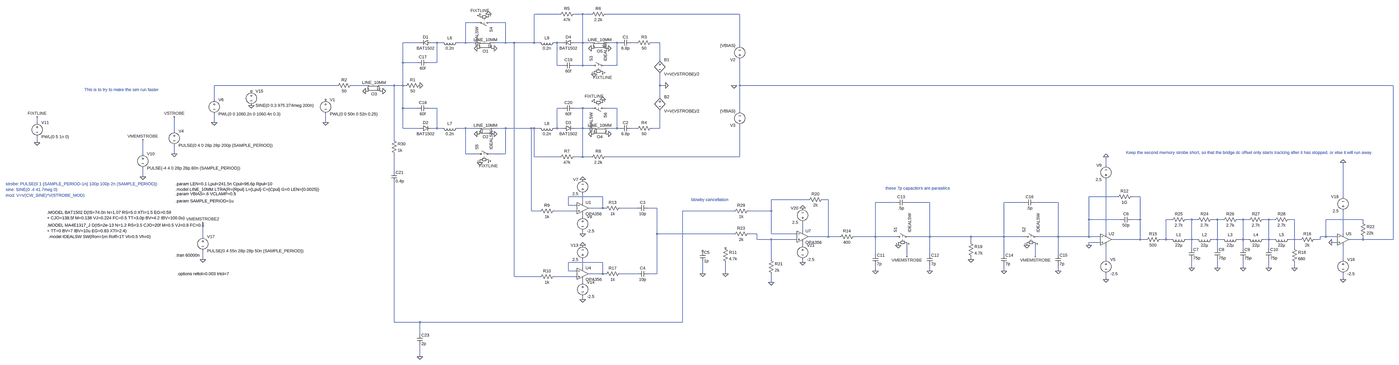
[diagram p0: schematic Draft17.asc, whole sheet]
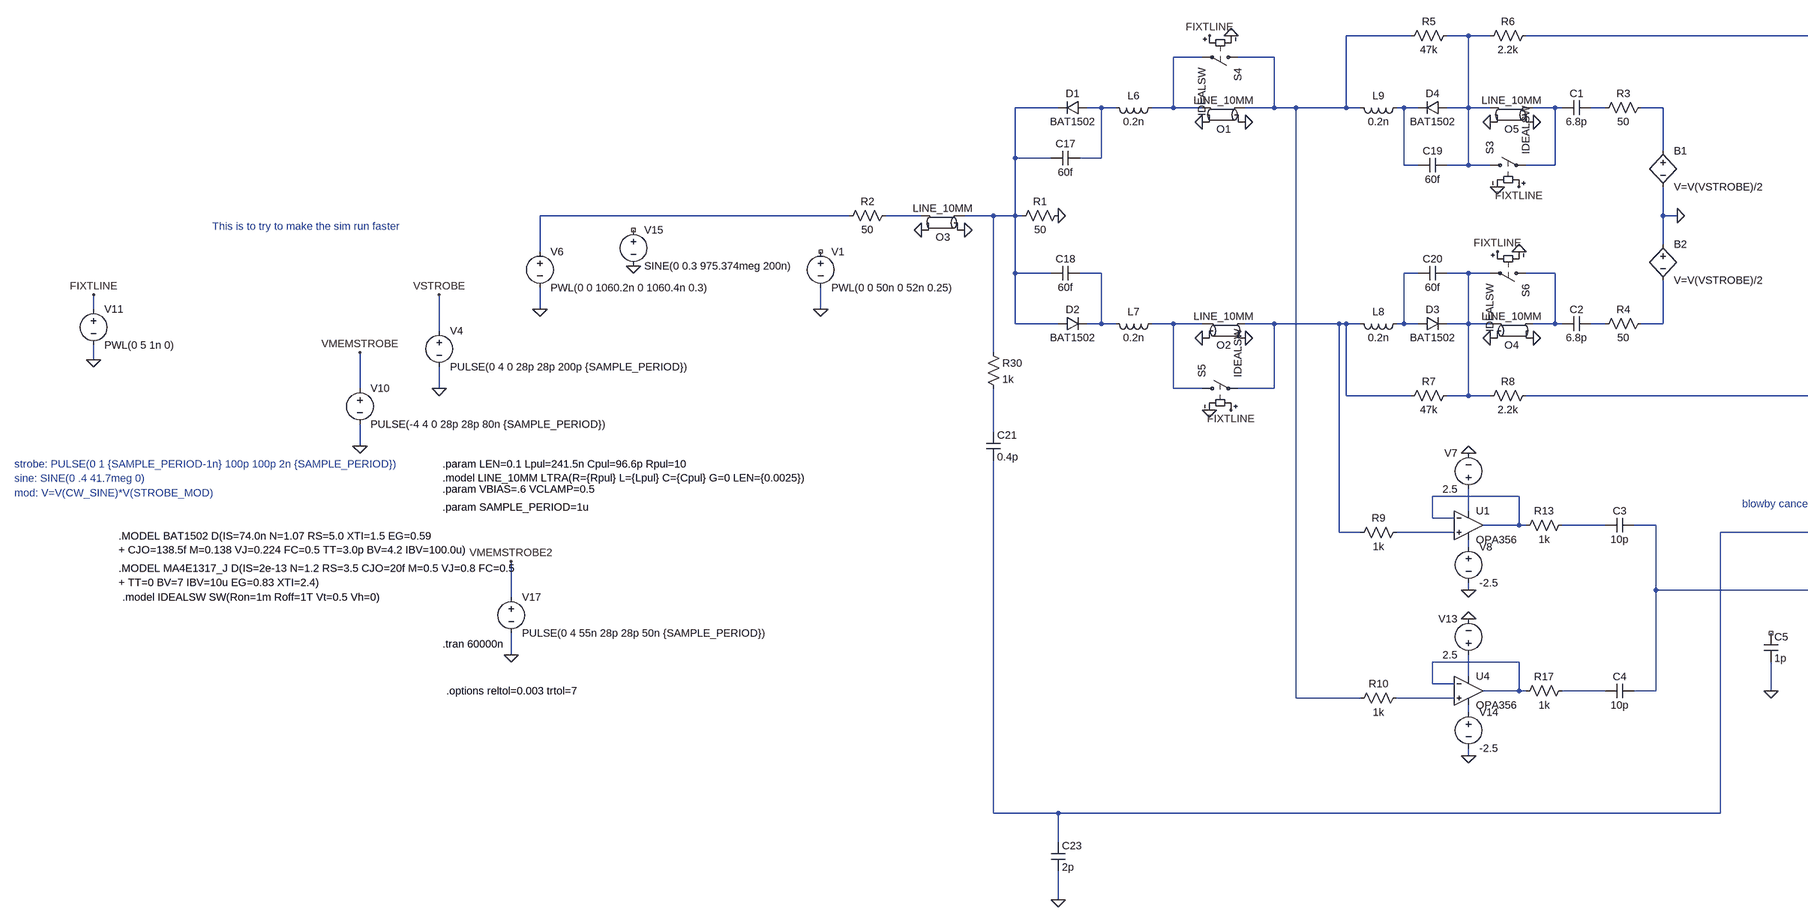
[diagram p1: schematic Draft17.asc, part, row 1 of 1, column 1 of 2]
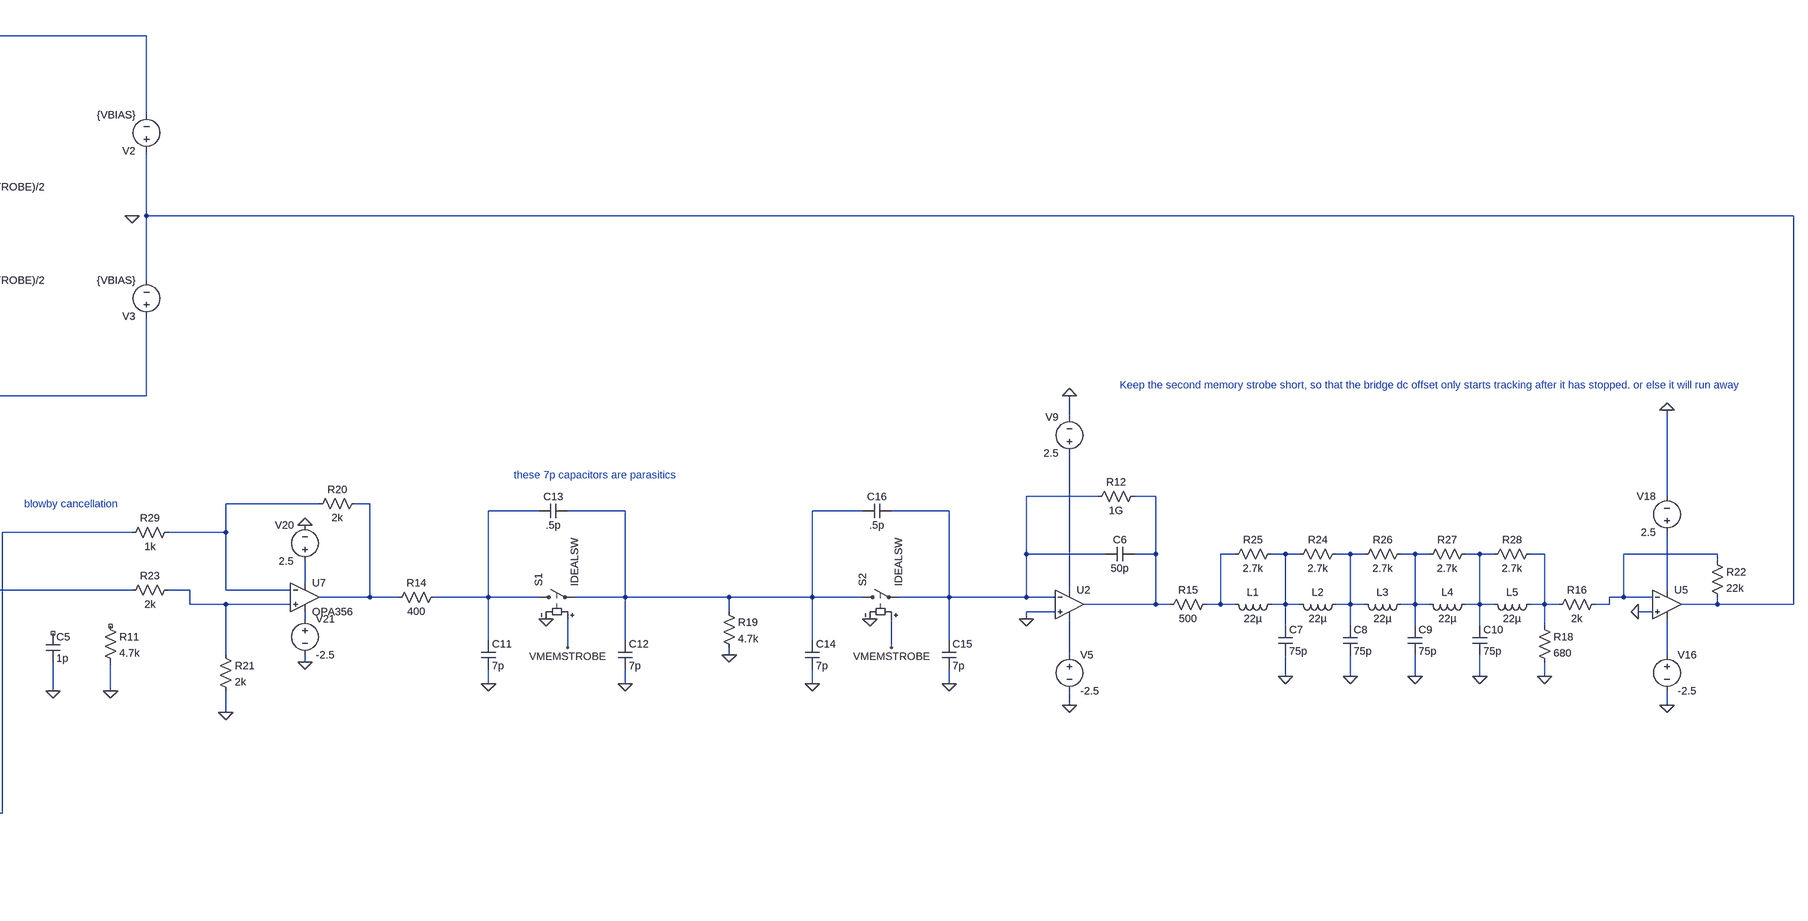
[diagram p2: schematic Draft17.asc, part, row 1 of 1, column 2 of 2]
Draft17.asc, the LTspice schematic file:
Version 4.1
SHEET 1 6916 1460
WIRE 1440 -656 1296 -656
WIRE 1568 -656 1520 -656
WIRE 1616 -656 1568 -656
WIRE 2448 -656 1696 -656
WIRE 976 -608 912 -608
WIRE 1136 -608 1056 -608
WIRE 656 -496 560 -496
WIRE 752 -496 720 -496
WIRE 784 -496 752 -496
WIRE 912 -496 912 -608
WIRE 912 -496 864 -496
WIRE 976 -496 912 -496
WIRE 1136 -496 1136 -608
WIRE 1136 -496 1072 -496
WIRE 1184 -496 1136 -496
WIRE 1296 -496 1296 -656
WIRE 1296 -496 1184 -496
WIRE 1328 -496 1296 -496
WIRE 1424 -496 1408 -496
WIRE 1456 -496 1424 -496
WIRE 1568 -496 1568 -656
WIRE 1568 -496 1520 -496
WIRE 1616 -496 1568 -496
WIRE 1760 -496 1712 -496
WIRE 1776 -496 1760 -496
WIRE 1872 -496 1840 -496
WIRE 2000 -496 1952 -496
WIRE 2448 -480 2448 -656
WIRE 2000 -400 2000 -496
WIRE 560 -384 560 -496
WIRE 640 -384 560 -384
WIRE 752 -384 752 -496
WIRE 752 -384 704 -384
WIRE 1424 -368 1424 -496
WIRE 1456 -368 1424 -368
WIRE 1568 -368 1568 -496
WIRE 1568 -368 1520 -368
WIRE 1616 -368 1568 -368
WIRE 1760 -368 1760 -496
WIRE 1760 -368 1696 -368
WIRE 192 -256 -496 -256
WIRE 352 -256 272 -256
WIRE 512 -256 448 -256
WIRE 560 -256 560 -384
WIRE 560 -256 512 -256
WIRE 576 -256 560 -256
WIRE 2000 -256 2000 -320
WIRE 2032 -256 2000 -256
WIRE 2448 -256 2448 -400
WIRE 6912 -256 2448 -256
WIRE 2000 -192 2000 -256
WIRE -496 -176 -496 -256
WIRE 560 -128 560 -256
WIRE 640 -128 560 -128
WIRE 752 -128 704 -128
WIRE 1456 -128 1424 -128
WIRE 1568 -128 1520 -128
WIRE 1616 -128 1568 -128
WIRE 1760 -128 1696 -128
WIRE 2448 -112 2448 -256
WIRE -1488 -48 -1488 -80
WIRE -496 -48 -496 -96
WIRE 128 -48 128 -96
WIRE 560 -16 560 -128
WIRE 656 -16 560 -16
WIRE 752 -16 752 -128
WIRE 752 -16 720 -16
WIRE 784 -16 752 -16
WIRE 912 -16 864 -16
WIRE 976 -16 912 -16
WIRE 1136 -16 1072 -16
WIRE 1280 -16 1136 -16
WIRE 1296 -16 1280 -16
WIRE 1328 -16 1296 -16
WIRE 1424 -16 1424 -128
WIRE 1424 -16 1408 -16
WIRE 1456 -16 1424 -16
WIRE 1568 -16 1568 -128
WIRE 1568 -16 1520 -16
WIRE 1616 -16 1568 -16
WIRE 1760 -16 1760 -128
WIRE 1760 -16 1712 -16
WIRE 1776 -16 1760 -16
WIRE 1872 -16 1840 -16
WIRE 2000 -16 2000 -112
WIRE 2000 -16 1952 -16
WIRE -720 0 -720 -80
WIRE 512 48 512 -256
WIRE -1488 64 -1488 32
WIRE -896 128 -896 48
WIRE -720 128 -720 80
WIRE 912 128 912 -16
WIRE 976 128 912 128
WIRE 1136 128 1136 -16
WIRE 1136 128 1056 128
WIRE 1296 144 1296 -16
WIRE 1440 144 1296 144
WIRE 1568 144 1568 -16
WIRE 1568 144 1520 144
WIRE 1616 144 1568 144
WIRE 2448 144 2448 -32
WIRE 2448 144 1696 144
WIRE 4976 192 4976 144
WIRE 512 224 512 128
WIRE -896 256 -896 208
WIRE 1680 368 1488 368
WIRE 5040 368 4880 368
WIRE 5168 368 5120 368
WIRE 6304 368 6304 176
WIRE 2832 384 2624 384
WIRE 2944 384 2912 384
WIRE 1568 400 1568 352
WIRE 3360 400 3248 400
WIRE 3552 400 3424 400
WIRE 4368 400 4256 400
WIRE 4560 400 4432 400
WIRE 1488 416 1488 368
WIRE 1536 416 1488 416
WIRE 1680 432 1680 368
WIRE 1680 432 1600 432
WIRE 1696 432 1680 432
WIRE 1872 432 1776 432
WIRE 1984 432 1936 432
WIRE 1280 448 1280 -16
WIRE 1328 448 1280 448
WIRE 1536 448 1408 448
WIRE 2416 448 2128 448
WIRE 2624 448 2624 384
WIRE 2624 448 2496 448
WIRE 1568 480 1568 464
WIRE 4880 496 4880 368
WIRE 5056 496 4880 496
WIRE 5168 496 5168 368
WIRE 5168 496 5120 496
WIRE 5344 496 5312 496
WIRE 5456 496 5424 496
WIRE 5488 496 5456 496
WIRE 5600 496 5568 496
WIRE 5632 496 5600 496
WIRE 5744 496 5712 496
WIRE 5776 496 5744 496
WIRE 5888 496 5856 496
WIRE 5920 496 5888 496
WIRE 6032 496 6000 496
WIRE 6416 496 6208 496
WIRE 6416 512 6416 496
WIRE 2800 560 2800 512
WIRE 1568 576 1568 560
WIRE 1984 576 1984 432
WIRE 2416 576 1984 576
WIRE 2544 576 2496 576
WIRE 2624 576 2624 448
WIRE 2768 576 2624 576
WIRE 4976 576 4976 272
WIRE 6304 576 6304 448
WIRE -560 592 -560 512
WIRE 2944 592 2944 384
WIRE 2944 592 2832 592
WIRE 3008 592 2944 592
WIRE 3248 592 3248 400
WIRE 3248 592 3088 592
WIRE 3360 592 3248 592
WIRE 3552 592 3552 400
WIRE 3552 592 3440 592
WIRE 3888 592 3552 592
WIRE 4256 592 4256 400
WIRE 4256 592 3888 592
WIRE 4368 592 4256 592
WIRE 4560 592 4560 400
WIRE 4560 592 4448 592
WIRE 4880 592 4880 496
WIRE 4880 592 4560 592
WIRE 4944 592 4880 592
WIRE 6208 592 6208 496
WIRE 6208 592 6176 592
WIRE 6272 592 6208 592
WIRE 2544 608 2544 576
WIRE 2624 608 2544 608
WIRE 2768 608 2624 608
WIRE 5168 608 5168 496
WIRE 5168 608 5008 608
WIRE 5200 608 5168 608
WIRE 5312 608 5312 496
WIRE 5312 608 5280 608
WIRE 5344 608 5312 608
WIRE 5456 608 5456 496
WIRE 5456 608 5424 608
WIRE 5488 608 5456 608
WIRE 5600 608 5600 496
WIRE 5600 608 5568 608
WIRE 5632 608 5600 608
WIRE 5744 608 5744 496
WIRE 5744 608 5712 608
WIRE 5776 608 5744 608
WIRE 5888 608 5888 496
WIRE 5888 608 5856 608
WIRE 5920 608 5888 608
WIRE 6032 608 6032 496
WIRE 6032 608 6000 608
WIRE 6064 608 6032 608
WIRE 6176 608 6176 592
WIRE 6176 608 6144 608
WIRE 6416 608 6416 592
WIRE 6416 608 6336 608
WIRE 6912 608 6912 -256
WIRE 6912 608 6416 608
WIRE 3888 624 3888 592
WIRE 4944 624 4880 624
WIRE 6272 624 6240 624
WIRE 2800 640 2800 624
WIRE 4880 640 4880 624
WIRE 5456 656 5456 608
WIRE 5600 656 5600 608
WIRE 5744 656 5744 608
WIRE 5888 656 5888 608
WIRE 6032 656 6032 608
WIRE 3248 688 3248 592
WIRE 3552 688 3552 592
WIRE 4256 688 4256 592
WIRE 4560 688 4560 592
WIRE 3424 704 3424 640
WIRE 4432 704 4432 640
WIRE -560 720 -560 672
WIRE 2624 720 2624 608
WIRE 3888 720 3888 704
WIRE 4976 720 4976 640
WIRE 6304 720 6304 640
WIRE 1680 736 1488 736
WIRE 2800 736 2800 720
WIRE 1568 768 1568 720
WIRE 5456 768 5456 720
WIRE 5600 768 5600 720
WIRE 5744 768 5744 720
WIRE 5888 768 5888 720
WIRE 6032 768 6032 736
WIRE 1488 784 1488 736
WIRE 1536 784 1488 784
WIRE 3248 784 3248 752
WIRE 3552 784 3552 752
WIRE 4256 784 4256 752
WIRE 4560 784 4560 752
WIRE 1680 800 1680 736
WIRE 1680 800 1600 800
WIRE 1696 800 1680 800
WIRE 1872 800 1776 800
WIRE 1984 800 1984 576
WIRE 1984 800 1936 800
WIRE 2240 800 2240 736
WIRE 2368 800 2368 736
WIRE 1184 816 1184 -496
WIRE 1328 816 1184 816
WIRE 1536 816 1408 816
WIRE 4976 832 4976 800
WIRE 6304 832 6304 800
WIRE 1568 848 1568 832
WIRE 2624 848 2624 800
WIRE 1568 944 1568 928
WIRE 512 1232 512 288
WIRE 656 1232 512 1232
WIRE 2128 1232 2128 448
WIRE 2128 1232 656 1232
WIRE 656 1296 656 1232
WIRE 656 1424 656 1360
FLAG 128 -48 0
FLAG 1072 16 0
FLAG 976 16 0
FLAG 976 -464 0
FLAG 1072 -464 0
FLAG 448 -224 0
FLAG 352 -224 0
FLAG 656 -256 0
FLAG 1712 16 0
FLAG 1616 16 0
FLAG 1616 -464 0
FLAG 1712 -464 0
FLAG 2032 -256 0
FLAG -720 128 0
FLAG -720 -80 VSTROBE
FLAG 2416 -256 0
FLAG -496 -48 0
FLAG 2368 800 0
FLAG 2240 800 0
FLAG 4880 640 0
FLAG 4976 144 0
FLAG 4976 832 0
FLAG -896 256 0
FLAG -896 48 VMEMSTROBE
FLAG 3424 704 VMEMSTROBE
FLAG 3376 640 0
FLAG -560 720 0
FLAG -560 512 VMEMSTROBE2
FLAG 2800 736 0
FLAG 2800 432 0
FLAG 1568 576 0
FLAG 1568 272 0
FLAG 1568 944 0
FLAG 1568 640 0
FLAG -288 -144 0
FLAG 6304 176 0
FLAG 6304 832 0
FLAG 5456 768 0
FLAG 5600 768 0
FLAG 5744 768 0
FLAG 5888 768 0
FLAG 3552 784 0
FLAG 3248 784 0
FLAG 6240 624 0
FLAG 6032 768 0
FLAG 4432 704 VMEMSTROBE
FLAG 4384 640 0
FLAG 4560 784 0
FLAG 4256 784 0
FLAG 3888 720 0
FLAG 1632 -320 0
FLAG 1680 -320 FIXTLINE
FLAG 1040 -656 0
FLAG 992 -656 FIXTLINE
FLAG 992 176 0
FLAG 1040 176 FIXTLINE
FLAG 1680 -176 0
FLAG 1632 -176 FIXTLINE
FLAG -1488 -80 FIXTLINE
FLAG -1488 64 0
FLAG 2624 848 0
FLAG 656 1424 0
SYMBOL voltage 128 -192 R0
WINDOW 123 0 0 Left 0
WINDOW 39 0 0 Left 0
SYMATTR InstName V1
SYMATTR Value PWL(0 0 50n 0 52n 0.25)
SYMBOL diode 720 -512 R90
WINDOW 0 0 32 VBottom 2
WINDOW 3 32 32 VTop 2
SYMATTR InstName D1
SYMATTR Value BAT1502
SYMBOL ltline 1024 -480 R180
SYMATTR InstName O1
SYMATTR Value LINE_10MM
SYMBOL ltline 1024 0 M180
SYMATTR InstName O2
SYMATTR Value LINE_10MM
SYMBOL diode 656 -32 M90
WINDOW 0 0 32 VBottom 2
WINDOW 3 32 32 VTop 2
SYMATTR InstName D2
SYMATTR Value BAT1502
SYMBOL diode 1456 -32 M90
WINDOW 0 0 32 VBottom 2
WINDOW 3 32 32 VTop 2
SYMATTR InstName D3
SYMATTR Value BAT1502
SYMBOL diode 1520 -512 R90
WINDOW 0 0 32 VBottom 2
WINDOW 3 32 32 VTop 2
SYMATTR InstName D4
SYMATTR Value BAT1502
SYMBOL res 672 -272 R90
WINDOW 0 0 56 VBottom 2
WINDOW 3 32 56 VTop 2
SYMATTR InstName R1
SYMATTR Value 50
SYMBOL ltline 400 -240 R180
SYMATTR InstName O3
SYMATTR Value LINE_10MM
SYMBOL res 288 -272 R90
WINDOW 0 0 56 VBottom 2
WINDOW 3 32 56 VTop 2
SYMATTR InstName R2
SYMATTR Value 50
SYMBOL ltline 1664 0 M180
SYMATTR InstName O4
SYMATTR Value LINE_10MM
SYMBOL ltline 1664 -480 R180
SYMATTR InstName O5
SYMATTR Value LINE_10MM
SYMBOL cap 1840 -512 R90
WINDOW 0 0 32 VBottom 2
WINDOW 3 32 32 VTop 2
SYMATTR InstName C1
SYMATTR Value 6.8p
SYMBOL cap 1840 -32 R90
WINDOW 0 0 32 VBottom 2
WINDOW 3 32 32 VTop 2
SYMATTR InstName C2
SYMATTR Value 6.8p
SYMBOL res 1968 -512 R90
WINDOW 0 0 56 VBottom 2
WINDOW 3 32 56 VTop 2
SYMATTR InstName R3
SYMATTR Value 50
SYMBOL res 1968 -32 R90
WINDOW 0 0 56 VBottom 2
WINDOW 3 32 56 VTop 2
SYMATTR InstName R4
SYMATTR Value 50
SYMBOL voltage -720 -16 R0
WINDOW 123 0 0 Left 0
WINDOW 39 0 0 Left 0
SYMATTR InstName V4
SYMATTR Value PULSE(0 4 0 28p 28p 200p {SAMPLE_PERIOD})
SYMBOL bv 2000 -416 R0
SYMATTR InstName B1
SYMATTR Value V=V(VSTROBE)/2
SYMBOL bv 2000 -208 R0
SYMATTR InstName B2
SYMATTR Value V=V(VSTROBE)/2
SYMBOL res 1536 -672 R90
WINDOW 0 0 56 VBottom 2
WINDOW 3 32 56 VTop 2
SYMATTR InstName R5
SYMATTR Value 47k
SYMBOL res 1712 -672 R90
WINDOW 0 0 56 VBottom 2
WINDOW 3 32 56 VTop 2
SYMATTR InstName R6
SYMATTR Value 2.2k
SYMBOL res 1536 128 R90
WINDOW 0 0 56 VBottom 2
WINDOW 3 32 56 VTop 2
SYMATTR InstName R7
SYMATTR Value 47k
SYMBOL res 1712 128 R90
WINDOW 0 0 56 VBottom 2
WINDOW 3 32 56 VTop 2
SYMATTR InstName R8
SYMATTR Value 2.2k
SYMBOL voltage 2448 -384 R180
WINDOW 123 0 0 Left 0
WINDOW 39 0 0 Left 0
SYMATTR InstName V2
SYMATTR Value {VBIAS}
SYMBOL voltage 2448 -16 R180
WINDOW 123 0 0 Left 0
WINDOW 39 0 0 Left 0
SYMATTR InstName V3
SYMATTR Value {VBIAS}
SYMBOL res 1424 432 R90
WINDOW 0 0 56 VBottom 2
WINDOW 3 32 56 VTop 2
SYMATTR InstName R9
SYMATTR Value 1k
SYMBOL res 1424 800 R90
WINDOW 0 0 56 VBottom 2
WINDOW 3 32 56 VTop 2
SYMATTR InstName R10
SYMATTR Value 1k
SYMBOL cap 1936 416 R90
WINDOW 0 0 32 VBottom 2
WINDOW 3 32 32 VTop 2
SYMATTR InstName C3
SYMATTR Value 10p
SYMBOL cap 1936 784 R90
WINDOW 0 0 32 VBottom 2
WINDOW 3 32 32 VTop 2
SYMATTR InstName C4
SYMATTR Value 10p
SYMBOL voltage -496 -192 R0
WINDOW 123 0 0 Left 0
WINDOW 39 0 0 Left 0
SYMATTR InstName V6
SYMATTR Value PWL(0 0 1060.2n 0 1060.4n 0.3)
SYMBOL cap 2224 672 R0
SYMATTR InstName C5
SYMATTR Value 1p
SYMBOL res 3104 576 R90
WINDOW 0 0 56 VBottom 2
WINDOW 3 32 56 VTop 2
SYMATTR InstName R14
SYMATTR Value 400
SYMBOL sw 3344 592 R270
SYMATTR InstName S1
SYMATTR Value IDEALSW
SYMBOL OpAmps\\UniversalOpamp2 4976 608 R0
SYMATTR InstName U2
SYMATTR Value2 Avol=1Meg GBW=100Meg Slew=100Meg
SYMBOL cap 5120 480 R90
WINDOW 0 0 32 VBottom 2
WINDOW 3 32 32 VTop 2
SYMATTR InstName C6
SYMATTR Value 50p
SYMBOL voltage 4976 704 R0
WINDOW 123 0 0 Left 0
WINDOW 39 0 0 Left 0
SYMATTR InstName V5
SYMATTR Value -2.5
SYMBOL voltage 4976 288 R180
WINDOW 0 24 96 Left 2
WINDOW 3 24 16 Left 2
WINDOW 123 0 0 Left 0
WINDOW 39 0 0 Left 0
SYMATTR InstName V9
SYMATTR Value 2.5
SYMBOL voltage -896 112 R0
WINDOW 123 0 0 Left 0
WINDOW 39 0 0 Left 0
SYMATTR InstName V10
SYMATTR Value PULSE(-4 4 0 28p 28p 80n {SAMPLE_PERIOD})
SYMBOL voltage -560 576 R0
WINDOW 123 0 0 Left 0
WINDOW 39 0 0 Left 0
SYMATTR InstName V17
SYMATTR Value PULSE(0 4 55n 28p 28p 50n {SAMPLE_PERIOD})
SYMBOL OPA356 2800 528 R0
SYMATTR InstName U7
SYMBOL voltage 2800 528 R180
WINDOW 0 24 96 Left 2
WINDOW 3 24 16 Left 2
WINDOW 123 0 0 Left 0
WINDOW 39 0 0 Left 0
SYMATTR InstName V20
SYMATTR Value 2.5
SYMBOL voltage 2800 624 R0
WINDOW 123 0 0 Left 0
WINDOW 39 0 0 Left 0
SYMATTR InstName V21
SYMATTR Value -2.5
SYMBOL res 5136 352 R90
WINDOW 0 0 56 VBottom 2
WINDOW 3 32 56 VTop 2
SYMATTR InstName R12
SYMATTR Value 1G
SYMBOL OPA356 1568 368 R0
SYMATTR InstName U1
SYMBOL voltage 1568 368 R180
WINDOW 0 24 96 Left 2
WINDOW 3 24 16 Left 2
WINDOW 123 0 0 Left 0
WINDOW 39 0 0 Left 0
SYMATTR InstName V7
SYMATTR Value 2.5
SYMBOL voltage 1568 464 R0
WINDOW 123 0 0 Left 0
WINDOW 39 0 0 Left 0
SYMATTR InstName V8
SYMATTR Value -2.5
SYMBOL OPA356 1568 736 R0
SYMATTR InstName U4
SYMBOL voltage 1568 736 R180
WINDOW 0 24 96 Left 2
WINDOW 3 24 16 Left 2
WINDOW 123 0 0 Left 0
WINDOW 39 0 0 Left 0
SYMATTR InstName V13
SYMATTR Value 2.5
SYMBOL voltage 1568 832 R0
WINDOW 123 0 0 Left 0
WINDOW 39 0 0 Left 0
SYMATTR InstName V14
SYMATTR Value -2.5
SYMBOL res 1792 416 R90
WINDOW 0 0 56 VBottom 2
WINDOW 3 32 56 VTop 2
SYMATTR InstName R13
SYMATTR Value 1k
SYMBOL res 1792 784 R90
WINDOW 0 0 56 VBottom 2
WINDOW 3 32 56 VTop 2
SYMATTR InstName R17
SYMATTR Value 1k
SYMBOL voltage -288 -240 R0
WINDOW 123 0 0 Left 0
WINDOW 39 0 0 Left 0
SYMATTR InstName V15
SYMATTR Value SINE(0 0.3 975.374meg 200n)
SYMBOL OpAmps\\UniversalOpamp2 6304 608 R0
SYMATTR InstName U5
SYMATTR Value2 Avol=1Meg GBW=100Meg Slew=100Meg
SYMBOL voltage 6304 704 R0
WINDOW 123 0 0 Left 0
WINDOW 39 0 0 Left 0
SYMATTR InstName V16
SYMATTR Value -2.5
SYMBOL voltage 6304 464 R180
WINDOW 0 24 96 Left 2
WINDOW 3 24 16 Left 2
WINDOW 123 0 0 Left 0
WINDOW 39 0 0 Left 0
SYMATTR InstName V18
SYMATTR Value 2.5
SYMBOL res 5296 592 R90
WINDOW 0 0 56 VBottom 2
WINDOW 3 32 56 VTop 2
SYMATTR InstName R15
SYMATTR Value 500
SYMBOL res 6400 496 R0
SYMATTR InstName R22
SYMATTR Value 22k
SYMBOL ind 5328 592 M90
WINDOW 0 5 56 VBottom 2
WINDOW 3 32 56 VTop 2
SYMATTR InstName L1
SYMATTR Value 22µ
SYMBOL cap 5440 656 R0
SYMATTR InstName C7
SYMATTR Value 75p
SYMBOL ind 5472 592 M90
WINDOW 0 5 56 VBottom 2
WINDOW 3 32 56 VTop 2
SYMATTR InstName L2
SYMATTR Value 22µ
SYMBOL cap 5584 656 R0
SYMATTR InstName C8
SYMATTR Value 75p
SYMBOL ind 5616 592 M90
WINDOW 0 5 56 VBottom 2
WINDOW 3 32 56 VTop 2
SYMATTR InstName L3
SYMATTR Value 22µ
SYMBOL cap 5728 656 R0
SYMATTR InstName C9
SYMATTR Value 75p
SYMBOL ind 5760 592 M90
WINDOW 0 5 56 VBottom 2
WINDOW 3 32 56 VTop 2
SYMATTR InstName L4
SYMATTR Value 22µ
SYMBOL cap 5872 656 R0
SYMATTR InstName C10
SYMATTR Value 75p
SYMBOL ind 5904 592 M90
WINDOW 0 5 56 VBottom 2
WINDOW 3 32 56 VTop 2
SYMATTR InstName L5
SYMATTR Value 22µ
SYMBOL res 5440 480 R90
WINDOW 0 0 56 VBottom 2
WINDOW 3 32 56 VTop 2
SYMATTR InstName R25
SYMATTR Value 2.7k
SYMBOL res 5584 480 R90
WINDOW 0 0 56 VBottom 2
WINDOW 3 32 56 VTop 2
SYMATTR InstName R24
SYMATTR Value 2.7k
SYMBOL res 5728 480 R90
WINDOW 0 0 56 VBottom 2
WINDOW 3 32 56 VTop 2
SYMATTR InstName R26
SYMATTR Value 2.7k
SYMBOL res 5872 480 R90
WINDOW 0 0 56 VBottom 2
WINDOW 3 32 56 VTop 2
SYMATTR InstName R27
SYMATTR Value 2.7k
SYMBOL res 6016 480 R90
WINDOW 0 0 56 VBottom 2
WINDOW 3 32 56 VTop 2
SYMATTR InstName R28
SYMATTR Value 2.7k
SYMBOL cap 3232 688 R0
SYMATTR InstName C11
SYMATTR Value 7p
SYMBOL cap 3536 688 R0
SYMATTR InstName C12
SYMATTR Value 7p
SYMBOL cap 3424 384 R90
WINDOW 0 0 32 VBottom 2
WINDOW 3 32 32 VTop 2
SYMATTR InstName C13
SYMATTR Value .5p
SYMBOL res 2352 640 R0
SYMATTR InstName R11
SYMATTR Value 4.7k
SYMBOL res 6160 592 R90
WINDOW 0 0 56 VBottom 2
WINDOW 3 32 56 VTop 2
SYMATTR InstName R16
SYMATTR Value 2k
SYMBOL res 6016 640 R0
SYMATTR InstName R18
SYMATTR Value 680
SYMBOL sw 4352 592 R270
SYMATTR InstName S2
SYMATTR Value IDEALSW
SYMBOL cap 4240 688 R0
SYMATTR InstName C14
SYMATTR Value 7p
SYMBOL cap 4544 688 R0
SYMATTR InstName C15
SYMATTR Value 7p
SYMBOL cap 4432 384 R90
WINDOW 0 0 32 VBottom 2
WINDOW 3 32 32 VTop 2
SYMATTR InstName C16
SYMATTR Value .5p
SYMBOL res 3872 608 R0
SYMATTR InstName R19
SYMATTR Value 4.7k
SYMBOL cap 704 -400 R90
WINDOW 0 0 32 VBottom 2
WINDOW 3 32 32 VTop 2
SYMATTR InstName C17
SYMATTR Value 60f
SYMBOL cap 704 -144 R90
WINDOW 0 0 32 VBottom 2
WINDOW 3 32 32 VTop 2
SYMATTR InstName C18
SYMATTR Value 60f
SYMBOL ind 880 -512 R90
WINDOW 0 5 56 VBottom 2
WINDOW 3 32 56 VTop 2
SYMATTR InstName L6
SYMATTR Value 0.2n
SYMATTR SpiceLine Rser=1m
SYMBOL ind 880 -32 R90
WINDOW 0 5 56 VBottom 2
WINDOW 3 32 56 VTop 2
SYMATTR InstName L7
SYMATTR Value 0.2n
SYMATTR SpiceLine Rser=1m
SYMBOL ind 1424 -32 R90
WINDOW 0 5 56 VBottom 2
WINDOW 3 32 56 VTop 2
SYMATTR InstName L8
SYMATTR Value 0.2n
SYMATTR SpiceLine Rser=1m
SYMBOL ind 1424 -512 R90
WINDOW 0 5 56 VBottom 2
WINDOW 3 32 56 VTop 2
SYMATTR InstName L9
SYMATTR Value 0.2n
SYMATTR SpiceLine Rser=1m
SYMBOL cap 1520 -384 R90
WINDOW 0 0 32 VBottom 2
WINDOW 3 32 32 VTop 2
SYMATTR InstName C19
SYMATTR Value 60f
SYMBOL cap 1520 -144 R90
WINDOW 0 0 32 VBottom 2
WINDOW 3 32 32 VTop 2
SYMATTR InstName C20
SYMATTR Value 60f
SYMBOL sw 1600 -368 R270
SYMATTR InstName S3
SYMATTR Value IDEALSW
SYMBOL sw 1072 -608 R90
SYMATTR InstName S4
SYMATTR Value IDEALSW
SYMBOL sw 960 128 R270
SYMATTR InstName S5
SYMATTR Value IDEALSW
SYMBOL sw 1712 -128 R90
SYMATTR InstName S6
SYMATTR Value IDEALSW
SYMBOL voltage -1488 -64 R0
WINDOW 123 0 0 Left 0
WINDOW 39 0 0 Left 0
SYMATTR InstName V11
SYMATTR Value PWL(0 5 1n 0)
SYMBOL res 2928 368 R90
WINDOW 0 0 56 VBottom 2
WINDOW 3 32 56 VTop 2
SYMATTR InstName R20
SYMATTR Value 2k
SYMBOL res 2608 704 R0
SYMATTR InstName R21
SYMATTR Value 2k
SYMBOL res 2512 560 R90
WINDOW 0 0 56 VBottom 2
WINDOW 3 32 56 VTop 2
SYMATTR InstName R23
SYMATTR Value 2k
SYMBOL res 2512 432 R90
WINDOW 0 0 56 VBottom 2
WINDOW 3 32 56 VTop 2
SYMATTR InstName R29
SYMATTR Value 1k
SYMBOL res 496 32 R0
SYMATTR InstName R30
SYMATTR Value 1k
SYMBOL cap 496 224 R0
SYMATTR InstName C21
SYMATTR Value 0.4p
SYMBOL cap 640 1296 R0
SYMATTR InstName C23
SYMATTR Value 2p
TEXT -1432 456 Left 2 !.MODEL BAT1502 D(IS=74.0n N=1.07 RS=5.0 XTI=1.5 EG=0.59\n+ CJO=138.5f M=0.138 VJ=0.224 FC=0.5 TT=3.0p BV=4.2 IBV=100.0u)
TEXT -712 296 Left 2 !.param LEN=0.1 Lpul=241.5n Cpul=96.6p Rpul=10\n.model LINE_10MM LTRA(R={Rpul} L={Lpul} C={Cpul} G=0 LEN={0.0025})
TEXT -712 696 Left 2 !.tran 60000n
TEXT -712 352 Left 2 !.param VBIAS=.6 VCLAMP=0.5
TEXT -1432 528 Left 2 !.MODEL MA4E1317_J D(IS=2e-13 N=1.2 RS=3.5 CJO=20f M=0.5 VJ=0.8 FC=0.5\n+ TT=0 BV=7 IBV=10u EG=0.83 XTI=2.4)
TEXT -1224 -232 Left 2 ;This is to try to make the sim run faster
TEXT -712 392 Left 2 !.param SAMPLE_PERIOD=1u
TEXT -1664 296 Left 2 ;strobe: PULSE(0 1 {SAMPLE_PERIOD-1n} 100p 100p 2n {SAMPLE_PERIOD})
TEXT -1664 328 Left 2 ;sine: SINE(0 .4 41.7meg 0)
TEXT -1664 360 Left 2 ;mod: V=V(CW_SINE)*V(STROBE_MOD)
TEXT -1424 592 Left 2 !.model IDEALSW SW(Ron=1m Roff=1T Vt=0.5 Vh=0)
TEXT 5088 120 Left 2 ;Keep the second memory strobe short, so that the bridge dc offset only starts tracking after it has stopped. or else it will run away
TEXT -704 800 Left 2 !.options reltol=0.003 trtol=7
TEXT 3304 320 Left 2 ;these 7p capacitors are parasitics
TEXT 2176 384 Left 2 ;blowby cancellation

The netlist it stands for:
* Draft17.asc
V1 NC_01 0 PWL(0 0 50n 0 52n 0.25)
D1 N006 N005 BAT1502
O1 0 N001 0 N004 LINE_10MM
O2 0 N018 0 N019 LINE_10MM
D2 N005 N014 BAT1502
D3 N015 N016 BAT1502
D4 N002 N007 BAT1502
R1 0 N005 50
O3 0 N005 0 N012 LINE_10MM
R2 N012 N011 50
O4 0 N016 0 N017 LINE_10MM
O5 0 N008 0 N002 LINE_10MM
C1 N009 N008 6.8p
C2 N020 N017 6.8p
R3 N010 N009 50
R4 N021 N020 50
V4 VSTROBE 0 PULSE(0 4 0 28p 28p 200p {SAMPLE_PERIOD})
B1 N010 0 V=V(VSTROBE)/2
B2 0 N021 V=V(VSTROBE)/2
R5 N002 N001 47k
R6 N003 N002 2.2k
R7 N016 N019 47k
R8 N022 N016 2.2k
V2 N013 N003 {VBIAS}
V3 N022 N013 {VBIAS}
R9 N034 N019 1k
R10 N054 N001 1k
C3 N033 N032 10p
C4 N033 N053 10p
V6 N011 0 PWL(0 0 1060.2n 0 1060.4n 0.3)
C5 NC_02 0 1p
R14 N030 N028 400
S1 N030 N031 VMEMSTROBE 0 IDEALSW
X§U2 0 N025 N046 N049 N026 level.2 Avol=1Meg GBW=100Meg Slew=100Meg ilimit=25m rail=0 Vos=0 phimargin=45 en=0 enk=0 in=0 ink=0 Rin=500Meg  ; pins IN+ IN- V+ V- OUT
C6 N026 N025 50p
V5 N049 0 -2.5
V9 N046 0 2.5
V10 VMEMSTROBE 0 PULSE(-4 4 0 28p 28p 80n {SAMPLE_PERIOD})
V17 VMEMSTROBE2 0 PULSE(0 4 55n 28p 28p 50n {SAMPLE_PERIOD})
* U7: OPA356 (symbol OPA356 not available, pins judged from their places): In+=N045 In-=N027 V+=N044 V-=N048 OUT=N028
V20 N044 0 2.5
V21 N048 0 -2.5
R12 N026 N025 1G
* U1: OPA356 (symbol OPA356 not available, pins judged from their places): In+=N034 In-=N024 V+=N029 V-=N036 OUT=N024
V7 N029 0 2.5
V8 N036 0 -2.5
* U4: OPA356 (symbol OPA356 not available, pins judged from their places): In+=N054 In-=N051 V+=N052 V-=N055 OUT=N051
V13 N052 0 2.5
V14 N055 0 -2.5
R13 N032 N024 1k
R17 N053 N051 1k
V15 NC_03 0 SINE(0 0.3 975.374meg 200n)
X§U5 0 N043 N047 N050 N013 level.2 Avol=1Meg GBW=100Meg Slew=100Meg ilimit=25m rail=0 Vos=0 phimargin=45 en=0 enk=0 in=0 ink=0 Rin=500Meg  ; pins IN+ IN- V+ V- OUT
V16 N050 0 -2.5
V18 N047 0 2.5
R15 N037 N026 500
R22 N043 N013 22k
L1 N037 N038 22µ
C7 N038 0 75p
L2 N038 N039 22µ
C8 N039 0 75p
L3 N039 N040 22µ
C9 N040 0 75p
L4 N040 N041 22µ
C10 N041 0 75p
L5 N041 N042 22µ
R25 N038 N037 2.7k
R24 N039 N038 2.7k
R26 N040 N039 2.7k
R27 N041 N040 2.7k
R28 N042 N041 2.7k
C11 N030 0 7p
C12 N031 0 7p
C13 N031 N030 .5p
R11 NC_04 0 4.7k
R16 N043 N042 2k
R18 N042 0 680
S2 N031 N025 VMEMSTROBE 0 IDEALSW
C14 N031 0 7p
C15 N025 0 7p
C16 N025 N031 .5p
R19 N031 0 4.7k
C17 N006 N005 60f
C18 N014 N005 60f
L6 N004 N006 0.2n Rser=1m
L7 N018 N014 0.2n Rser=1m
L8 N015 N019 0.2n Rser=1m
L9 N007 N001 0.2n Rser=1m
C19 N002 N007 60f
C20 N016 N015 60f
S3 N002 N008 FIXTLINE 0 IDEALSW
S4 N001 N004 FIXTLINE 0 IDEALSW
S5 N018 N019 FIXTLINE 0 IDEALSW
S6 N017 N016 FIXTLINE 0 IDEALSW
V11 FIXTLINE 0 PWL(0 5 1n 0)
R20 N028 N027 2k
R21 N045 0 2k
R23 N045 N033 2k
R29 N027 N035 1k
R30 N005 N023 1k
C21 N023 N035 0.4p
C23 N035 0 2p
.model D D
.lib standard.dio
.MODEL BAT1502 D(IS=74.0n N=1.07 RS=5.0 XTI=1.5 EG=0.59
+ CJO=138.5f M=0.138 VJ=0.224 FC=0.5 TT=3.0p BV=4.2 IBV=100.0u)
.param LEN=0.1 Lpul=241.5n Cpul=96.6p Rpul=10
.model LINE_10MM LTRA(R={Rpul} L={Lpul} C={Cpul} G=0 LEN={0.0025})
.tran 60000n
.param VBIAS=.6 VCLAMP=0.5
.MODEL MA4E1317_J D(IS=2e-13 N=1.2 RS=3.5 CJO=20f M=0.5 VJ=0.8 FC=0.5
+ TT=0 BV=7 IBV=10u EG=0.83 XTI=2.4)
* This is to try to make the sim run faster
.param SAMPLE_PERIOD=1u
* strobe: PULSE(0 1 {SAMPLE_PERIOD-1n} 100p 100p 2n {SAMPLE_PERIOD})
* sine: SINE(0 .4 41.7meg 0)
* mod: V=V(CW_SINE)*V(STROBE_MOD)
.model IDEALSW SW(Ron=1m Roff=1T Vt=0.5 Vh=0)
* Keep the second memory strobe short, so that the bridge dc offset only starts tracking after it has stopped. or else it will run away
.options reltol=0.003 trtol=7
* these 7p capacitors are parasitics
* blowby cancellation
.lib UniversalOpamps2.sub
.backanno
.end